# Altium schematic sheet DSP大板子.SchDoc (part 7 of 7)
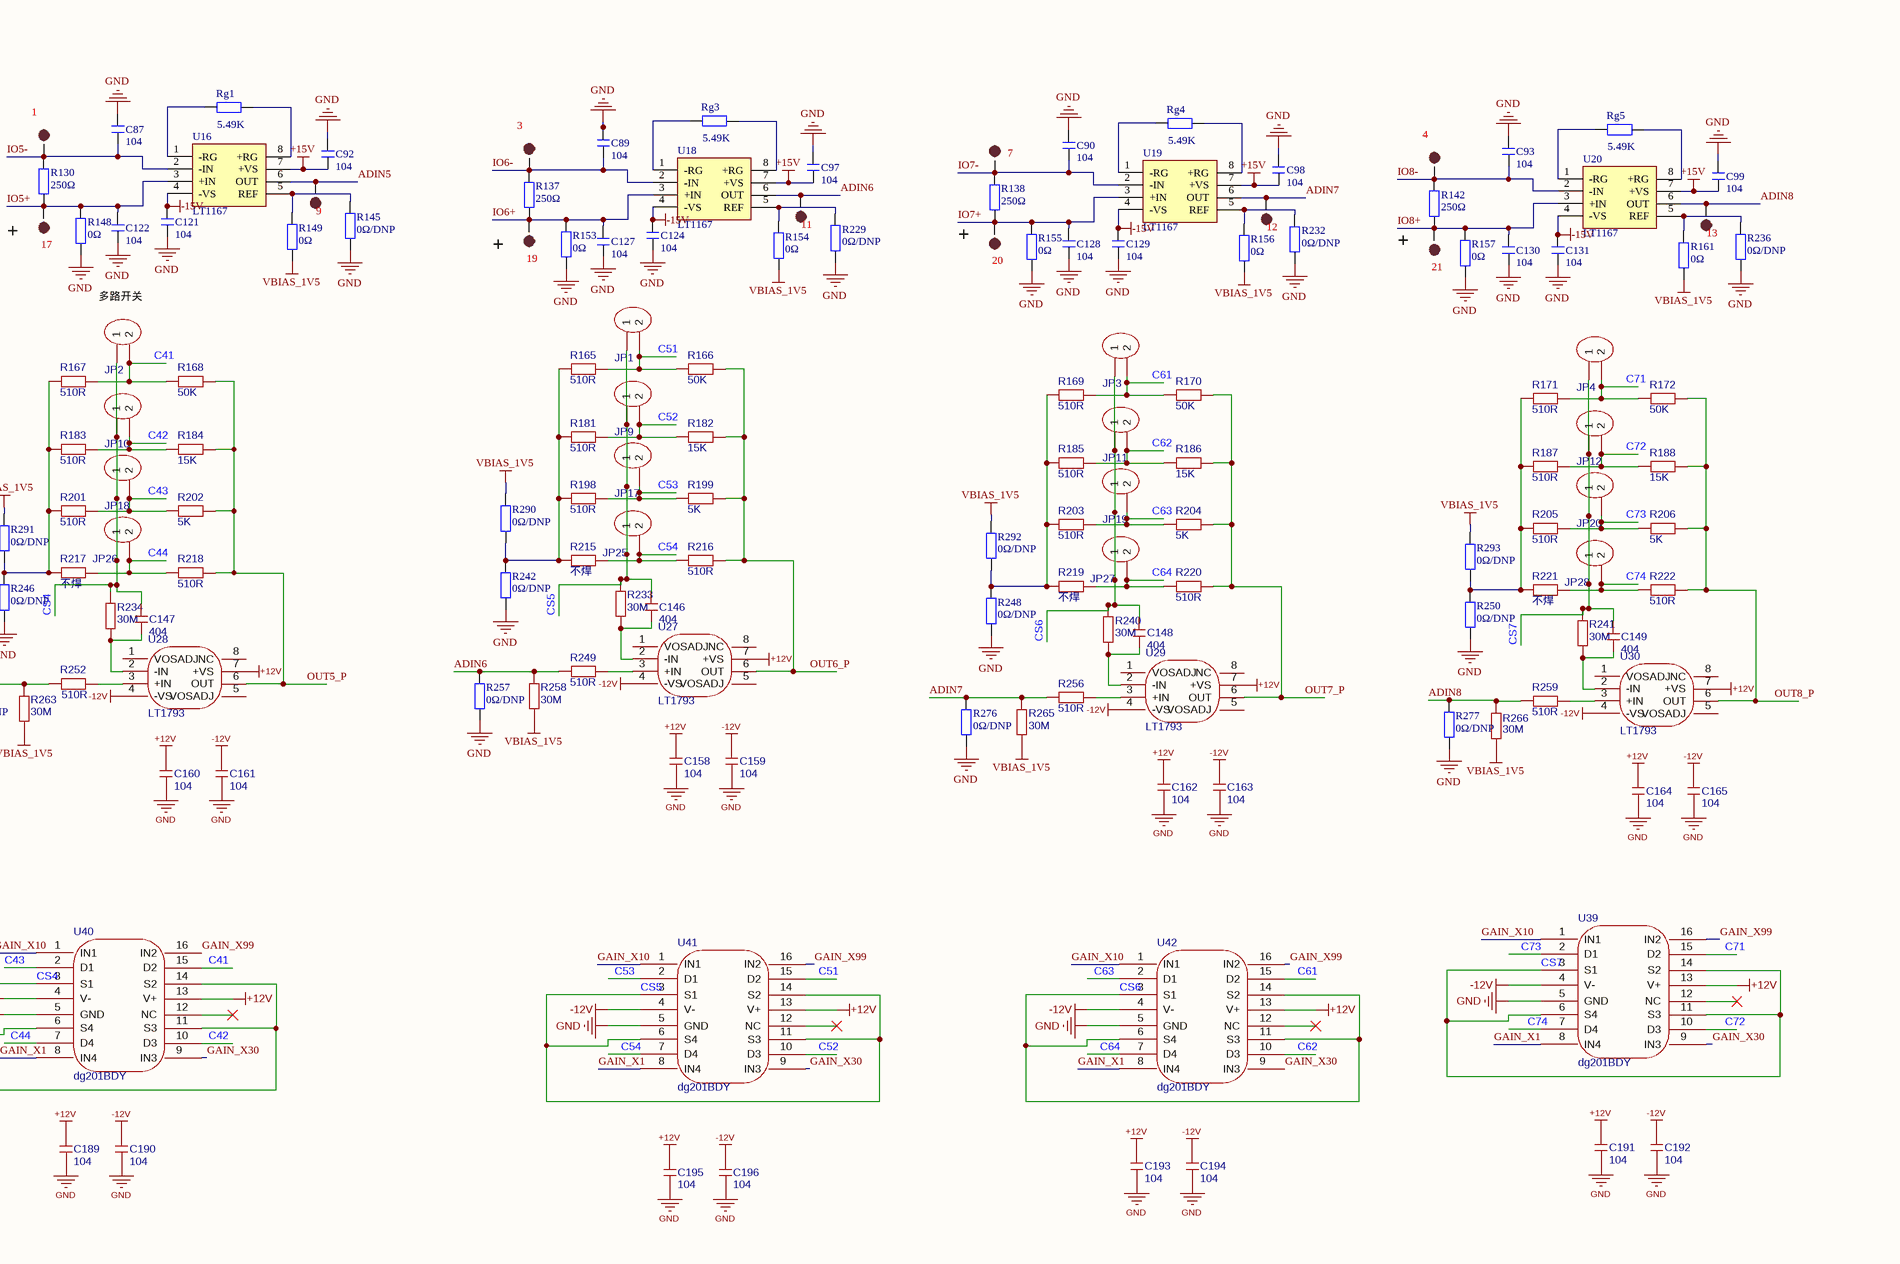
[diagram p8: DSP大板子.SchDoc, bottom right]

## Library data of the parts (continued)
R240 = R: 贴片电阻; 版权归属: 来自淘宝 ID：黄晶宝石; 封装库来自淘宝卖家 ID：黄晶宝石: 其他店铺购入均为盗版，不享受售后技术支持服务，请立即申请退款; Origin Footprint: R 0201_L; OriginFootprint 2: R 0402_L; OriginFootprint 3: R 0805_L; OriginFootprint 4: R 1206_L; OriginFootprint 5: R 1210_L; OriginFootprint 6: R 1812_L; OriginFootprint 7: R 2010_L; OriginFootprint 8: R 2512_L; OriginFootprint 9: R 0201_M; OriginFootprint 10: R 0402_M; OriginFootprint 11: R 0603_M; OriginFootprint 12: R 0805_M; OriginFootprint 13: R 1206_M; OriginFootprint 14: R 1210_M; OriginFootprint 15: R 1812_M; OriginFootprint 16: R 2010_M; OriginFootprint 17: R 2512_M; UniqueId: d3271885c7b6eafc; AddInBom: yes; OriginModelName: R 0603; Device: R; BOM名称: 贴片电阻; 联系售后: https://shop463601444.taobao.com; DesignItemID: R; LibraryName: 0.1 - 电阻-电容-电感; SymbolName: R; FootprintName: R 0603_L
R241 = R: 贴片电阻; 版权归属: 来自淘宝 ID：黄晶宝石; 封装库来自淘宝卖家 ID：黄晶宝石: 其他店铺购入均为盗版，不享受售后技术支持服务，请立即申请退款; Origin Footprint: R 0201_L; OriginFootprint 2: R 0402_L; OriginFootprint 3: R 0805_L; OriginFootprint 4: R 1206_L; OriginFootprint 5: R 1210_L; OriginFootprint 6: R 1812_L; OriginFootprint 7: R 2010_L; OriginFootprint 8: R 2512_L; OriginFootprint 9: R 0201_M; OriginFootprint 10: R 0402_M; OriginFootprint 11: R 0603_M; OriginFootprint 12: R 0805_M; OriginFootprint 13: R 1206_M; OriginFootprint 14: R 1210_M; OriginFootprint 15: R 1812_M; OriginFootprint 16: R 2010_M; OriginFootprint 17: R 2512_M; UniqueId: 81023e11c17a14a6; AddInBom: yes; OriginModelName: R 0603; Device: R; BOM名称: 贴片电阻; 联系售后: https://shop463601444.taobao.com; DesignItemID: R; LibraryName: 0.1 - 电阻-电容-电感; SymbolName: R; FootprintName: R 0603_L
R243 = R: 贴片电阻; 版权归属: 来自淘宝 ID：黄晶宝石; 封装库来自淘宝卖家 ID：黄晶宝石: 其他店铺购入均为盗版，不享受售后技术支持服务，请立即申请退款; Origin Footprint: R 0201_L; OriginFootprint 2: R 0402_L; OriginFootprint 3: R 0805_L; OriginFootprint 4: R 1206_L; OriginFootprint 5: R 1210_L; OriginFootprint 6: R 1812_L; OriginFootprint 7: R 2010_L; OriginFootprint 8: R 2512_L; OriginFootprint 9: R 0201_M; OriginFootprint 10: R 0402_M; OriginFootprint 11: R 0603_M; OriginFootprint 12: R 0805_M; OriginFootprint 13: R 1206_M; OriginFootprint 14: R 1210_M; OriginFootprint 15: R 1812_M; OriginFootprint 16: R 2010_M; OriginFootprint 17: R 2512_M; UniqueId: a074999702fa02e6; AddInBom: yes; OriginModelName: R 0603; Device: R; BOM名称: 贴片电阻; 联系售后: https://shop463601444.taobao.com; DesignItemID: R; LibraryName: 0.1 - 电阻-电容-电感; SymbolName: R; FootprintName: R 0603_L
R244 = R: 贴片电阻; 版权归属: 来自淘宝 ID：黄晶宝石; 封装库来自淘宝卖家 ID：黄晶宝石: 其他店铺购入均为盗版，不享受售后技术支持服务，请立即申请退款; Origin Footprint: R 0201_L; OriginFootprint 2: R 0402_L; OriginFootprint 3: R 0805_L; OriginFootprint 4: R 1206_L; OriginFootprint 5: R 1210_L; OriginFootprint 6: R 1812_L; OriginFootprint 7: R 2010_L; OriginFootprint 8: R 2512_L; OriginFootprint 9: R 0201_M; OriginFootprint 10: R 0402_M; OriginFootprint 11: R 0603_M; OriginFootprint 12: R 0805_M; OriginFootprint 13: R 1206_M; OriginFootprint 14: R 1210_M; OriginFootprint 15: R 1812_M; OriginFootprint 16: R 2010_M; OriginFootprint 17: R 2512_M; UniqueId: f8fa280bb9d4afdb; AddInBom: yes; OriginModelName: R 0603; Device: R; BOM名称: 贴片电阻; 联系售后: https://shop463601444.taobao.com; DesignItemID: R; LibraryName: 0.1 - 电阻-电容-电感; SymbolName: R; FootprintName: R 0603_L
R245 = R: 贴片电阻; 版权归属: 来自淘宝 ID：黄晶宝石; 封装库来自淘宝卖家 ID：黄晶宝石: 其他店铺购入均为盗版，不享受售后技术支持服务，请立即申请退款; Origin Footprint: R 0201_L; OriginFootprint 2: R 0402_L; OriginFootprint 3: R 0805_L; OriginFootprint 4: R 1206_L; OriginFootprint 5: R 1210_L; OriginFootprint 6: R 1812_L; OriginFootprint 7: R 2010_L; OriginFootprint 8: R 2512_L; OriginFootprint 9: R 0201_M; OriginFootprint 10: R 0402_M; OriginFootprint 11: R 0603_M; OriginFootprint 12: R 0805_M; OriginFootprint 13: R 1206_M; OriginFootprint 14: R 1210_M; OriginFootprint 15: R 1812_M; OriginFootprint 16: R 2010_M; OriginFootprint 17: R 2512_M; UniqueId: 780e728bcbe3c478; AddInBom: yes; OriginModelName: R 0603; Device: R; BOM名称: 贴片电阻; 联系售后: https://shop463601444.taobao.com; DesignItemID: R; LibraryName: 0.1 - 电阻-电容-电感; SymbolName: R; FootprintName: R 0603_L
R247 = R: 贴片电阻; 版权归属: 来自淘宝 ID：黄晶宝石; 封装库来自淘宝卖家 ID：黄晶宝石: 其他店铺购入均为盗版，不享受售后技术支持服务，请立即申请退款; Origin Footprint: R 0201_L; OriginFootprint 2: R 0402_L; OriginFootprint 3: R 0805_L; OriginFootprint 4: R 1206_L; OriginFootprint 5: R 1210_L; OriginFootprint 6: R 1812_L; OriginFootprint 7: R 2010_L; OriginFootprint 8: R 2512_L; OriginFootprint 9: R 0201_M; OriginFootprint 10: R 0402_M; OriginFootprint 11: R 0603_M; OriginFootprint 12: R 0805_M; OriginFootprint 13: R 1206_M; OriginFootprint 14: R 1210_M; OriginFootprint 15: R 1812_M; OriginFootprint 16: R 2010_M; OriginFootprint 17: R 2512_M; UniqueId: 61aee2c7162d13e5; AddInBom: yes; OriginModelName: R 0603; Device: R; BOM名称: 贴片电阻; 联系售后: https://shop463601444.taobao.com; DesignItemID: R; LibraryName: 0.1 - 电阻-电容-电感; SymbolName: R; FootprintName: R 0603_L
R249 = R: 贴片电阻; 版权归属: 来自淘宝 ID：黄晶宝石; 封装库来自淘宝卖家 ID：黄晶宝石: 其他店铺购入均为盗版，不享受售后技术支持服务，请立即申请退款; Origin Footprint: R 0201_L; OriginFootprint 2: R 0402_L; OriginFootprint 3: R 0805_L; OriginFootprint 4: R 1206_L; OriginFootprint 5: R 1210_L; OriginFootprint 6: R 1812_L; OriginFootprint 7: R 2010_L; OriginFootprint 8: R 2512_L; OriginFootprint 9: R 0201_M; OriginFootprint 10: R 0402_M; OriginFootprint 11: R 0603_M; OriginFootprint 12: R 0805_M; OriginFootprint 13: R 1206_M; OriginFootprint 14: R 1210_M; OriginFootprint 15: R 1812_M; OriginFootprint 16: R 2010_M; OriginFootprint 17: R 2512_M; UniqueId: a8dad4614b19f40e; AddInBom: yes; OriginModelName: R 0603; Device: R; BOM名称: 贴片电阻; 联系售后: https://shop463601444.taobao.com; DesignItemID: R; LibraryName: 0.1 - 电阻-电容-电感; SymbolName: R; FootprintName: R 0603_L
R252 = R: 贴片电阻; 版权归属: 来自淘宝 ID：黄晶宝石; 封装库来自淘宝卖家 ID：黄晶宝石: 其他店铺购入均为盗版，不享受售后技术支持服务，请立即申请退款; Origin Footprint: R 0201_L; OriginFootprint 2: R 0402_L; OriginFootprint 3: R 0805_L; OriginFootprint 4: R 1206_L; OriginFootprint 5: R 1210_L; OriginFootprint 6: R 1812_L; OriginFootprint 7: R 2010_L; OriginFootprint 8: R 2512_L; OriginFootprint 9: R 0201_M; OriginFootprint 10: R 0402_M; OriginFootprint 11: R 0603_M; OriginFootprint 12: R 0805_M; OriginFootprint 13: R 1206_M; OriginFootprint 14: R 1210_M; OriginFootprint 15: R 1812_M; OriginFootprint 16: R 2010_M; OriginFootprint 17: R 2512_M; UniqueId: 09a288aa9d6e3d92; AddInBom: yes; OriginModelName: R 0603; Device: R; BOM名称: 贴片电阻; 联系售后: https://shop463601444.taobao.com; DesignItemID: R; LibraryName: 0.1 - 电阻-电容-电感; SymbolName: R; FootprintName: R 0603_L
R256 = R: 贴片电阻; 版权归属: 来自淘宝 ID：黄晶宝石; 封装库来自淘宝卖家 ID：黄晶宝石: 其他店铺购入均为盗版，不享受售后技术支持服务，请立即申请退款; Origin Footprint: R 0201_L; OriginFootprint 2: R 0402_L; OriginFootprint 3: R 0805_L; OriginFootprint 4: R 1206_L; OriginFootprint 5: R 1210_L; OriginFootprint 6: R 1812_L; OriginFootprint 7: R 2010_L; OriginFootprint 8: R 2512_L; OriginFootprint 9: R 0201_M; OriginFootprint 10: R 0402_M; OriginFootprint 11: R 0603_M; OriginFootprint 12: R 0805_M; OriginFootprint 13: R 1206_M; OriginFootprint 14: R 1210_M; OriginFootprint 15: R 1812_M; OriginFootprint 16: R 2010_M; OriginFootprint 17: R 2512_M; UniqueId: 7c41b6516f1c60a6; AddInBom: yes; OriginModelName: R 0603; Device: R; BOM名称: 贴片电阻; 联系售后: https://shop463601444.taobao.com; DesignItemID: R; LibraryName: 0.1 - 电阻-电容-电感; SymbolName: R; FootprintName: R 0603_L
R258 = R: 贴片电阻; 版权归属: 来自淘宝 ID：黄晶宝石; 封装库来自淘宝卖家 ID：黄晶宝石: 其他店铺购入均为盗版，不享受售后技术支持服务，请立即申请退款; Origin Footprint: R 0201_L; OriginFootprint 2: R 0402_L; OriginFootprint 3: R 0805_L; OriginFootprint 4: R 1206_L; OriginFootprint 5: R 1210_L; OriginFootprint 6: R 1812_L; OriginFootprint 7: R 2010_L; OriginFootprint 8: R 2512_L; OriginFootprint 9: R 0201_M; OriginFootprint 10: R 0402_M; OriginFootprint 11: R 0603_M; OriginFootprint 12: R 0805_M; OriginFootprint 13: R 1206_M; OriginFootprint 14: R 1210_M; OriginFootprint 15: R 1812_M; OriginFootprint 16: R 2010_M; OriginFootprint 17: R 2512_M; UniqueId: 127bceab6ada68c7; AddInBom: yes; OriginModelName: R 0603; Device: R; BOM名称: 贴片电阻; 联系售后: https://shop463601444.taobao.com; DesignItemID: R; LibraryName: 0.1 - 电阻-电容-电感; SymbolName: R; FootprintName: R 0603_L
R259 = R: 贴片电阻; 版权归属: 来自淘宝 ID：黄晶宝石; 封装库来自淘宝卖家 ID：黄晶宝石: 其他店铺购入均为盗版，不享受售后技术支持服务，请立即申请退款; Origin Footprint: R 0201_L; OriginFootprint 2: R 0402_L; OriginFootprint 3: R 0805_L; OriginFootprint 4: R 1206_L; OriginFootprint 5: R 1210_L; OriginFootprint 6: R 1812_L; OriginFootprint 7: R 2010_L; OriginFootprint 8: R 2512_L; OriginFootprint 9: R 0201_M; OriginFootprint 10: R 0402_M; OriginFootprint 11: R 0603_M; OriginFootprint 12: R 0805_M; OriginFootprint 13: R 1206_M; OriginFootprint 14: R 1210_M; OriginFootprint 15: R 1812_M; OriginFootprint 16: R 2010_M; OriginFootprint 17: R 2512_M; UniqueId: 70403c1b3b132533; AddInBom: yes; OriginModelName: R 0603; Device: R; BOM名称: 贴片电阻; 联系售后: https://shop463601444.taobao.com; DesignItemID: R; LibraryName: 0.1 - 电阻-电容-电感; SymbolName: R; FootprintName: R 0603_L
R260 = R: 贴片电阻; 版权归属: 来自淘宝 ID：黄晶宝石; 封装库来自淘宝卖家 ID：黄晶宝石: 其他店铺购入均为盗版，不享受售后技术支持服务，请立即申请退款; Origin Footprint: R 0201_L; OriginFootprint 2: R 0402_L; OriginFootprint 3: R 0805_L; OriginFootprint 4: R 1206_L; OriginFootprint 5: R 1210_L; OriginFootprint 6: R 1812_L; OriginFootprint 7: R 2010_L; OriginFootprint 8: R 2512_L; OriginFootprint 9: R 0201_M; OriginFootprint 10: R 0402_M; OriginFootprint 11: R 0603_M; OriginFootprint 12: R 0805_M; OriginFootprint 13: R 1206_M; OriginFootprint 14: R 1210_M; OriginFootprint 15: R 1812_M; OriginFootprint 16: R 2010_M; OriginFootprint 17: R 2512_M; UniqueId: c7fcac2dc179deab; AddInBom: yes; OriginModelName: R 0603; Device: R; BOM名称: 贴片电阻; 联系售后: https://shop463601444.taobao.com; DesignItemID: R; LibraryName: 0.1 - 电阻-电容-电感; SymbolName: R; FootprintName: R 0603_L
R261 = R: 贴片电阻; 版权归属: 来自淘宝 ID：黄晶宝石; 封装库来自淘宝卖家 ID：黄晶宝石: 其他店铺购入均为盗版，不享受售后技术支持服务，请立即申请退款; Origin Footprint: R 0201_L; OriginFootprint 2: R 0402_L; OriginFootprint 3: R 0805_L; OriginFootprint 4: R 1206_L; OriginFootprint 5: R 1210_L; OriginFootprint 6: R 1812_L; OriginFootprint 7: R 2010_L; OriginFootprint 8: R 2512_L; OriginFootprint 9: R 0201_M; OriginFootprint 10: R 0402_M; OriginFootprint 11: R 0603_M; OriginFootprint 12: R 0805_M; OriginFootprint 13: R 1206_M; OriginFootprint 14: R 1210_M; OriginFootprint 15: R 1812_M; OriginFootprint 16: R 2010_M; OriginFootprint 17: R 2512_M; UniqueId: 3f1747bc7cd0165c; AddInBom: yes; OriginModelName: R 0603; Device: R; BOM名称: 贴片电阻; 联系售后: https://shop463601444.taobao.com; DesignItemID: R; LibraryName: 0.1 - 电阻-电容-电感; SymbolName: R; FootprintName: R 0603_L
R262 = R: 贴片电阻; 版权归属: 来自淘宝 ID：黄晶宝石; 封装库来自淘宝卖家 ID：黄晶宝石: 其他店铺购入均为盗版，不享受售后技术支持服务，请立即申请退款; Origin Footprint: R 0201_L; OriginFootprint 2: R 0402_L; OriginFootprint 3: R 0805_L; OriginFootprint 4: R 1206_L; OriginFootprint 5: R 1210_L; OriginFootprint 6: R 1812_L; OriginFootprint 7: R 2010_L; OriginFootprint 8: R 2512_L; OriginFootprint 9: R 0201_M; OriginFootprint 10: R 0402_M; OriginFootprint 11: R 0603_M; OriginFootprint 12: R 0805_M; OriginFootprint 13: R 1206_M; OriginFootprint 14: R 1210_M; OriginFootprint 15: R 1812_M; OriginFootprint 16: R 2010_M; OriginFootprint 17: R 2512_M; UniqueId: 086d1dd8ac2c5fca; AddInBom: yes; OriginModelName: R 0603; Device: R; BOM名称: 贴片电阻; 联系售后: https://shop463601444.taobao.com; DesignItemID: R; LibraryName: 0.1 - 电阻-电容-电感; SymbolName: R; FootprintName: R 0603_L
R263 = R: 贴片电阻; 版权归属: 来自淘宝 ID：黄晶宝石; 封装库来自淘宝卖家 ID：黄晶宝石: 其他店铺购入均为盗版，不享受售后技术支持服务，请立即申请退款; Origin Footprint: R 0201_L; OriginFootprint 2: R 0402_L; OriginFootprint 3: R 0805_L; OriginFootprint 4: R 1206_L; OriginFootprint 5: R 1210_L; OriginFootprint 6: R 1812_L; OriginFootprint 7: R 2010_L; OriginFootprint 8: R 2512_L; OriginFootprint 9: R 0201_M; OriginFootprint 10: R 0402_M; OriginFootprint 11: R 0603_M; OriginFootprint 12: R 0805_M; OriginFootprint 13: R 1206_M; OriginFootprint 14: R 1210_M; OriginFootprint 15: R 1812_M; OriginFootprint 16: R 2010_M; OriginFootprint 17: R 2512_M; UniqueId: 0b6333695f921556; AddInBom: yes; OriginModelName: R 0603; Device: R; BOM名称: 贴片电阻; 联系售后: https://shop463601444.taobao.com; DesignItemID: R; LibraryName: 0.1 - 电阻-电容-电感; SymbolName: R; FootprintName: R 0603_L
R264 = R: 贴片电阻; 版权归属: 来自淘宝 ID：黄晶宝石; 封装库来自淘宝卖家 ID：黄晶宝石: 其他店铺购入均为盗版，不享受售后技术支持服务，请立即申请退款; Origin Footprint: R 0201_L; OriginFootprint 2: R 0402_L; OriginFootprint 3: R 0805_L; OriginFootprint 4: R 1206_L; OriginFootprint 5: R 1210_L; OriginFootprint 6: R 1812_L; OriginFootprint 7: R 2010_L; OriginFootprint 8: R 2512_L; OriginFootprint 9: R 0201_M; OriginFootprint 10: R 0402_M; OriginFootprint 11: R 0603_M; OriginFootprint 12: R 0805_M; OriginFootprint 13: R 1206_M; OriginFootprint 14: R 1210_M; OriginFootprint 15: R 1812_M; OriginFootprint 16: R 2010_M; OriginFootprint 17: R 2512_M; UniqueId: 9e71ce6b7342da3b; AddInBom: yes; OriginModelName: R 0603; Device: R; BOM名称: 贴片电阻; 联系售后: https://shop463601444.taobao.com; DesignItemID: R; LibraryName: 0.1 - 电阻-电容-电感; SymbolName: R; FootprintName: R 0603_L
R265 = R: 贴片电阻; 版权归属: 来自淘宝 ID：黄晶宝石; 封装库来自淘宝卖家 ID：黄晶宝石: 其他店铺购入均为盗版，不享受售后技术支持服务，请立即申请退款; Origin Footprint: R 0201_L; OriginFootprint 2: R 0402_L; OriginFootprint 3: R 0805_L; OriginFootprint 4: R 1206_L; OriginFootprint 5: R 1210_L; OriginFootprint 6: R 1812_L; OriginFootprint 7: R 2010_L; OriginFootprint 8: R 2512_L; OriginFootprint 9: R 0201_M; OriginFootprint 10: R 0402_M; OriginFootprint 11: R 0603_M; OriginFootprint 12: R 0805_M; OriginFootprint 13: R 1206_M; OriginFootprint 14: R 1210_M; OriginFootprint 15: R 1812_M; OriginFootprint 16: R 2010_M; OriginFootprint 17: R 2512_M; UniqueId: 79cad709e969d650; AddInBom: yes; OriginModelName: R 0603; Device: R; BOM名称: 贴片电阻; 联系售后: https://shop463601444.taobao.com; DesignItemID: R; LibraryName: 0.1 - 电阻-电容-电感; SymbolName: R; FootprintName: R 0603_L
R266 = R: 贴片电阻; 版权归属: 来自淘宝 ID：黄晶宝石; 封装库来自淘宝卖家 ID：黄晶宝石: 其他店铺购入均为盗版，不享受售后技术支持服务，请立即申请退款; Origin Footprint: R 0201_L; OriginFootprint 2: R 0402_L; OriginFootprint 3: R 0805_L; OriginFootprint 4: R 1206_L; OriginFootprint 5: R 1210_L; OriginFootprint 6: R 1812_L; OriginFootprint 7: R 2010_L; OriginFootprint 8: R 2512_L; OriginFootprint 9: R 0201_M; OriginFootprint 10: R 0402_M; OriginFootprint 11: R 0603_M; OriginFootprint 12: R 0805_M; OriginFootprint 13: R 1206_M; OriginFootprint 14: R 1210_M; OriginFootprint 15: R 1812_M; OriginFootprint 16: R 2010_M; OriginFootprint 17: R 2512_M; UniqueId: d1ab67904d4ab3e5; AddInBom: yes; OriginModelName: R 0603; Device: R; BOM名称: 贴片电阻; 联系售后: https://shop463601444.taobao.com; DesignItemID: R; LibraryName: 0.1 - 电阻-电容-电感; SymbolName: R; FootprintName: R 0603_L
R267 = R: 贴片电阻; 版权归属: 来自淘宝 ID：黄晶宝石; 封装库来自淘宝卖家 ID：黄晶宝石: 其他店铺购入均为盗版，不享受售后技术支持服务，请立即申请退款; Origin Footprint: R 0201_L; OriginFootprint 2: R 0402_L; OriginFootprint 3: R 0805_L; OriginFootprint 4: R 1206_L; OriginFootprint 5: R 1210_L; OriginFootprint 6: R 1812_L; OriginFootprint 7: R 2010_L; OriginFootprint 8: R 2512_L; OriginFootprint 9: R 0201_M; OriginFootprint 10: R 0402_M; OriginFootprint 11: R 0603_M; OriginFootprint 12: R 0805_M; OriginFootprint 13: R 1206_M; OriginFootprint 14: R 1210_M; OriginFootprint 15: R 1812_M; OriginFootprint 16: R 2010_M; OriginFootprint 17: R 2512_M; UniqueId: f7952e9f9cd6773b; AddInBom: yes; OriginModelName: R 0603; Device: R; BOM名称: 贴片电阻; 联系售后: https://shop463601444.taobao.com; DesignItemID: R; LibraryName: 0.1 - 电阻-电容-电感; SymbolName: R; FootprintName: R 0603_L
R268 = R: 贴片电阻; 版权归属: 来自淘宝 ID：黄晶宝石; 封装库来自淘宝卖家 ID：黄晶宝石: 其他店铺购入均为盗版，不享受售后技术支持服务，请立即申请退款; Origin Footprint: R 0201_L; OriginFootprint 2: R 0402_L; OriginFootprint 3: R 0805_L; OriginFootprint 4: R 1206_L; OriginFootprint 5: R 1210_L; OriginFootprint 6: R 1812_L; OriginFootprint 7: R 2010_L; OriginFootprint 8: R 2512_L; OriginFootprint 9: R 0201_M; OriginFootprint 10: R 0402_M; OriginFootprint 11: R 0603_M; OriginFootprint 12: R 0805_M; OriginFootprint 13: R 1206_M; OriginFootprint 14: R 1210_M; OriginFootprint 15: R 1812_M; OriginFootprint 16: R 2010_M; OriginFootprint 17: R 2512_M; UniqueId: ee084f684bde39fa; AddInBom: yes; OriginModelName: R 0603; Device: R; BOM名称: 贴片电阻; 联系售后: https://shop463601444.taobao.com; DesignItemID: R; LibraryName: 0.1 - 电阻-电容-电感; SymbolName: R; FootprintName: R 0603_L
R269 = R: 贴片电阻; 版权归属: 来自淘宝 ID：黄晶宝石; 封装库来自淘宝卖家 ID：黄晶宝石: 其他店铺购入均为盗版，不享受售后技术支持服务，请立即申请退款; Origin Footprint: R 0201_L; OriginFootprint 2: R 0402_L; OriginFootprint 3: R 0805_L; OriginFootprint 4: R 1206_L; OriginFootprint 5: R 1210_L; OriginFootprint 6: R 1812_L; OriginFootprint 7: R 2010_L; OriginFootprint 8: R 2512_L; OriginFootprint 9: R 0201_M; OriginFootprint 10: R 0402_M; OriginFootprint 11: R 0603_M; OriginFootprint 12: R 0805_M; OriginFootprint 13: R 1206_M; OriginFootprint 14: R 1210_M; OriginFootprint 15: R 1812_M; OriginFootprint 16: R 2010_M; OriginFootprint 17: R 2512_M; UniqueId: 2eb3813281b987ab; AddInBom: yes; OriginModelName: R 0603; Device: R; BOM名称: 贴片电阻; 联系售后: https://shop463601444.taobao.com; DesignItemID: R; LibraryName: 0.1 - 电阻-电容-电感; SymbolName: R; FootprintName: R 0603_L
R270 = R: 贴片电阻; 版权归属: 来自淘宝 ID：黄晶宝石; 封装库来自淘宝卖家 ID：黄晶宝石: 其他店铺购入均为盗版，不享受售后技术支持服务，请立即申请退款; Origin Footprint: R 0201_L; OriginFootprint 2: R 0402_L; OriginFootprint 3: R 0805_L; OriginFootprint 4: R 1206_L; OriginFootprint 5: R 1210_L; OriginFootprint 6: R 1812_L; OriginFootprint 7: R 2010_L; OriginFootprint 8: R 2512_L; OriginFootprint 9: R 0201_M; OriginFootprint 10: R 0402_M; OriginFootprint 11: R 0603_M; OriginFootprint 12: R 0805_M; OriginFootprint 13: R 1206_M; OriginFootprint 14: R 1210_M; OriginFootprint 15: R 1812_M; OriginFootprint 16: R 2010_M; OriginFootprint 17: R 2512_M; UniqueId: fa394caafc8878d8; AddInBom: yes; OriginModelName: R 0603; Device: R; BOM名称: 贴片电阻; 联系售后: https://shop463601444.taobao.com; DesignItemID: R; LibraryName: 0.1 - 电阻-电容-电感; SymbolName: R; FootprintName: R 0603_L
R274 = rc0805fr-07100kl: 电阻类型:厚膜电阻;阻值:100kΩ;精度:±1%;功率:125mW;工作电压:150V;温度系数:±100ppm/℃;; Manufacturer: YAGEO(国巨); AddInBom: yes; ModelId: 37a81e68749a4138bd2dfa6897b24b85; ModelName: R0805_L2.0-W1.3-H0.6; ModelTransform: 78.74,51.181,0,0,0,0,0,-0.0005,0; Value: 100kΩ; Tolerance: ±1%; Power(Watts): 125mW; Voltage-Supply(Max): 150V; Symbol: RC0805FR-07100KL; LCSC Part Name: 厚膜电阻 100kΩ ±1% 125mW; SupplierPart: C96346; ManufacturerPart: RC0805FR-07100KL; Supplier Footprint: 0805; JLCPCB Part Class: Extended Part; Datasheet: https://item.szlcsc.com/datasheet/RC0805FR-07100KL/97550.html; Supplier: LCSC; ConvertToPcb: yes; FootprintName: R0805_NEW; Type: 厚膜电阻; Temperature Coefficient: ±100ppm/℃; Operating Temperature: -55℃~+155℃
RJ1 = si-46001-f: 连接器类型:RJ45插座;安装方式:弯插;端口数量:2;LED:带LED;屏蔽:有屏蔽;触头镀层:金;工作温度:0℃~+70℃;; Manufacturer: belfuse; AddInBom: yes; ModelId: 7e7265f4ce6d4878958776467abf3fc9; ModelTransform: 639.999,670.39236,0,0,0,0,0,-25.079,-157.48; Connector Type: RJ45插座; Number of Ports: 2; LED: 带LED; Shielding: 有屏蔽; PoE: 不带PoE; Symbol: SI-46001-F; LCSC Part Name: 弯插 带LED; SupplierPart: C19267755; ManufacturerPart: SI-46001-F; Supplier Footprint: RJ45-TH; JLCPCB Part Class: Extended Part; Datasheet: https://item.szlcsc.com/datasheet/SI-46001-F/20524665.html; Supplier: LCSC; ConvertToPcb: yes; FootprintName: RJ45-TH_BELFUSE_SI-46001-F; ModelName: RJ45-TH_BELFUSE_SI-46001-F; Mounting Type: 弯插; Contact Plating: 金; Operating Temperature: 0℃~+70℃
SW1 SW2 = TSW SMD-6x6: SW2; BOM名称: 贴片6x6轻触开关; 版权归属: 封装库来自淘宝 ID：黄晶宝石; 唯一出售店铺网址: https://shop463601444.taobao.com
SW3 = 2MS1T2B2VS2QES: BOM_Manufacturer: Dailywell; Contributor: LCSC; BOM_Supplier: LCSC; BOM_Supplier Part: C545202; BOM_Manufacturer Part: 2MS1T2B2VS2QES; BOM_JLCPCB Part Class: Extended Part; spicePre: S; spiceSymbolName: 2MS1T2B2VS2QES
U1 = CH340G: USB2UART
U2 = pc817x2csp9f: 输入类型:DC;正向压降(Vf):1.2V;输出电流:50mA;隔离电压(Vrms):5kV;直流反向耐压(Vr):6V;负载电压:80V;输出通道数:-;集射极饱和电压(VCE(sat)):200mV@20mA,1mA;; Manufacturer: SHARP(夏普); AddInBom: yes; ModelId: 991879f0d3e24dbd9895164815fb95aa; ModelName: SMD-4_L4.6-W6.5-H3.7-LS10.2-P2.54; ModelTransform: 401.94494,181.102,0,0,0,0,0,0.003,0; Input type: DC; Output Type: 光电三极管; Voltage - Forward(Vf): 1.2V; Output Current: 50mA; Isolation Voltage(Vrms): 5kV; Reverse Voltage: 6V; Load Voltage: 80V; Rise time: 4us; Fall time: 3us; Current Transfer Ratio (CTR) Minimum: 50%; Current Transfer Ratio (CTR) Maximum/Saturation Value: 600%; Total Power Dissipation(Pd): 200mW; Symbol: PC817X2CSP9F; LCSC Part Name: DC输入 隔离电压(rms):5000V; SupplierPart: C66405; ManufacturerPart: PC817X2CSP9F; Supplier Footprint: SMD-4P; JLCPCB Part Class: Extended Part; Datasheet: https://item.szlcsc.com/datasheet/PC817X2CSP9F/67489.html; Supplier: LCSC; ConvertToPcb: yes; FootprintName: SMD-4_L4.6-W6.5-P2.54-LS10.2-TL; Number of Outputs: -; Vce Saturation(VCE(sat)): 200mV@20mA,1mA; Operating Temperature: -30℃~+100℃; Forward Current(If): 50mA
U3 U10 = adau1979wbcpz-rl: 分辨率:24;工作电压:3.3V~3.6V;接口类型:I2C；SPI;; Manufacturer: ADI(亚德诺); AddInBom: yes; ModelId: 7c9bc19ca4c64354924a13059f0c15c7; ModelTransform: 237.007,237.007,0,0,0,0,0,0,0; Resolution: 24; Number of Channels: 4; Symbol: ADAU1979WBCPZ-RL; LCSC Part Name: 四通道模数转换器(ADC); SupplierPart: C207957; ManufacturerPart: ADAU1979WBCPZ-RL; Supplier Footprint: LFCSP-40(6x6); JLCPCB Part Class: Extended Part; Datasheet: https://item.szlcsc.com/datasheet/ADAU1979WBCPZ-RL/209011.html; Supplier: LCSC; ConvertToPcb: yes; FootprintName: QFN-40_L6.0-W6.0-P0.50-TL-EP4.1; ModelName: QFN-40_L6.0-W6.0-P0.50-TL-EP4.1; Voltage - Supply: 3.3V~3.6V; Interface Type: I2C；SPI; Operating Temperature: -40℃~+105℃
U4 = TJA1057GT3: CLASS: IC
U5 = m24c64-rmn6tp: 接口类型:I2C;存储容量:64Kbit;时钟频率(fc):1MHz;; Manufacturer: ST(意法半导体); AddInBom: yes; ModelId: 7abc64c95a1a4a04a4ef38f9097c870b; ModelTransform: 192.913,236.22,0,0,0,0,0,0,0; Interface: I2C; Memory Size: 64Kbit; Clock Frequency: 1MHz; Write Cycle Time(Tw): 5ms; Data Retention - TDR (Year): 200年; Write Cycle Endurance: 400万次; Voltage - Supply: 1.8V~5.5V; Symbol: M24C64-RMN6TP; LCSC Part Name: 64 Kbit串行I2C总线EEPROM; SupplierPart: C79988; ManufacturerPart: M24C64-RMN6TP; Supplier Footprint: SOIC-8; JLCPCB Part Class: Extended Part; Datasheet: https://item.szlcsc.com/datasheet/M24C64-RMN6TP/81133.html; Supplier: LCSC; ConvertToPcb: yes; FootprintName: SOIC-8_L5.0-W4.0-P1.27-LS6.0-BL; ModelName: SOIC-8_L5.0-W4.0-P1.27-LS6.0-BL; Features: 内置上电复位(POR)；硬件写保护功能；内置错误纠正码(ECC)功能; Operating Temperature: -40℃~+85℃
U6 = TJA1057GT3_8P: CLASS: IC
U7 U11 = gpha201-0202a001a1ba: 插针结构:2x2P;间距:2.54mm;行距:2.54mm;圆针/方针:方针;安装方式:直插;排数:双排;总PIN位数:4P;额定电流:3A;塑高:2.54mm;触头材质:黄铜;触头镀层:金;工作温度:-40℃~+105℃;颜色:黑色;; Manufacturer: GREENCONN(格康); AddInBom: yes; ModelId: 396726ecc332483f84428c142640bc15; ModelName: HDR-TH_4P-P2.54-M-LI-2X2P; ModelTransform: 200.03897,196.85,0,0,0,0,0,0,-118.11; Pin Structure: 2x2P; Pitch: 2.54mm; Circluar Pins/Square Pins: 方针; Current Rating: 3A; Symbol: GPHA201-0202A001A1BA; LCSC Part Name: 2x2P 间距:2.54mm 方针 直插; SupplierPart: C7434503; ManufacturerPart: GPHA201-0202A001A1BA; Supplier Footprint: 插件,P=2.54mm; JLCPCB Part Class: Extended Part; Datasheet: https://item.szlcsc.com/datasheet/GPHA201-0202A001A1BA/8446427.html; Supplier: LCSC; ConvertToPcb: yes; FootprintName: HDR-TH_4P-P2.54-V-M-R2-C2-S2.54; Row Spacing: 2.54mm; Mounting Type: 直插; Number of Rows: 双排; Number of Pins: 4P; Insulation Height: 2.54mm; Contact Material: 黄铜; Contact Plating: 金; Operating Temperature: -40℃~+105℃; Color: 黑色
U8 = hx pz2.54-1x2p zz: 插针结构:1x2P;间距:2.54mm;行距:-;圆针/方针:方针;安装方式:直插;排数:单排;总PIN位数:2P;额定电流:3A;额定电压:1kV;配合针长度:6mm;塑高:2.5mm;端接针长度:3mm;触头材质:黄铜;触头镀层:金;工作温度:-40℃~+105℃;颜色:黑色;; Manufacturer: hanxia(韩下); AddInBom: yes; ModelId: c7a9f3c3e6e34627af2bf939e464cb35; ModelName: HDR-TH_2P-P2.54-M-LI-1X2P; ModelTransform: 200,100,0,0,0,0,0,0,-118.11; Pin Structure: 1x2P; Pitch: 2.54mm; Circluar Pins/Square Pins: 方针; Current Rating: 3A; Voltage Rating (Max): 1kV; Symbol: HX PZ2.54-1X2P ZZ; LCSC Part Name: 1x2P 间距:2.54mm 方针 直插; SupplierPart: C32713268; ManufacturerPart: HX PZ2.54-1x2P ZZ; Supplier Footprint: 插件,P=2.54mm; JLCPCB Part Class: Extended Part; Datasheet: https://item.szlcsc.com/datasheet/HX%2520PZ2.54-1x2P%2520ZZ/34444548.html; Supplier: LCSC; ConvertToPcb: yes; FootprintName: HDR-TH_2P-P2.54-V-M-3; Row Spacing: -; Mounting Type: 直插; Number of Rows: 单排; Number of Pins: 2P; Length of Mating Pin: 6mm; Insulation Height: 2.5mm; Length of End Connection Pin: 3mm; Contact Material: 黄铜; Contact Plating: 金; Operating Temperature: -40℃~+105℃; Color: 黑色; Supplementary Features: -
U9 = mcp2515t-i/so: MCP2515是一款独立的CAN控制器，支持CAN V2.0B协议，数据传输速率为1 Mbps。它通过SPI接口与MCU通信。; Manufacturer: MICROCHIP(美国微芯); AddInBom: yes; ModelId: 591e416e62784c3bb8a96e1097595c87; ModelName: SOIC-18_L11.6-W7.5-H2.7-LS10.3-P1.27; ModelTransform: 456.692,409.68154,0,0,0,0,0,0,0; Data Rate: 1Mbps; Current - Supply: 5mA; Voltage - Supply: 2.7V~5.5V; Quiescent Supply Current: 1uA; Protocol: SPI; Symbol: MCP2515T-I/SO; LCSC Part Name: 独立CAN控制器带SPI接口; SupplierPart: C153782; ManufacturerPart: MCP2515T-I/SO; Supplier Footprint: SOIC-18-300mil; JLCPCB Part Class: Extended Part; Datasheet: https://item.szlcsc.com/datasheet/MCP2515T-I%252FSO/165124.html; Supplier: LCSC; ConvertToPcb: yes; FootprintName: SOIC-18_L11.6-W7.5-P1.27-LS10.3-BL; Type: CAN控制器; Operating Temperature: -40℃~+85℃; Features: 可编程位时序；单次发送模式；低功耗模式
U12 = ksz8081rnaca-tr: 类型:PHY收发器;端口数量:1;MAC接口:RMII;; Manufacturer: MICROCHIP(美国微芯); AddInBom: yes; ModelId: 1e6a51e223ba431598528b34e5bdfcc9; ModelName: QFN-24_L4.0-W4.0-H0.9-P0.50; ModelTransform: 157.48,157.48,0,90,0,0,0,0,0; Number of ports: 1; MAC Interface: RMII; Ethernet Speed Standards: 10BASE-T；100BASE-TX; Data Rate: 10Mbit/s；100Mbit/s; Voltage - Supply: 3.3V; Symbol: KSZ8081RNACA-TR; LCSC Part Name: KSZ8081RNA/RND 10BASE-T/100BASE-TX PHY 收发器; SupplierPart: C100017; ManufacturerPart: KSZ8081RNACA-TR; Supplier Footprint: QFN-24-EP(4x4); JLCPCB Part Class: Extended Part; Datasheet: https://item.szlcsc.com/datasheet/KSZ8081RNACA-TR/101231.html; Supplier: LCSC; ConvertToPcb: yes; FootprintName: QFN-24_L4.0-W4.0-P0.50-BL-EP2.6; Type: PHY收发器; Operating Temperature: 0℃~+70℃; Features: 错误检测与恢复；低功耗模式；可编程LED指示；电缆诊断
U13 = gpha101-0402a001a1ba: 插针结构:1x4P;间距:2.54mm;行距:2.54mm;圆针/方针:方针;安装方式:直插;排数:单排;总PIN位数:4P;额定电流:3A;塑高:2.54mm;触头材质:黄铜;触头镀层:金;工作温度:-40℃~+105℃;颜色:黑色;; Manufacturer: GREENCONN(格康); AddInBom: yes; ModelId: 112f4d05e8d64e99ab9a333894bea4f9; ModelName: HDR-TH_4P-P2.54-M-LI-1X4P; ModelTransform: 399.999,104.7242,0,0,0,0,0,0,-118.11; Pin Structure: 1x4P; Pitch: 2.54mm; Circluar Pins/Square Pins: 方针; Current Rating: 3A; Symbol: GPHA101-0402A001A1BA; LCSC Part Name: 1x4P 间距:2.54mm 方针 直插; SupplierPart: C7434478; ManufacturerPart: GPHA101-0402A001A1BA; Supplier Footprint: 插件,P=2.54mm; JLCPCB Part Class: Extended Part; Datasheet: https://item.szlcsc.com/datasheet/GPHA101-0402A001A1BA/8446402.html; Supplier: LCSC; ConvertToPcb: yes; FootprintName: HDR-TH_4P-P2.54-V-M; Row Spacing: 2.54mm; Mounting Type: 直插; Number of Rows: 单排; Number of Pins: 4P; Insulation Height: 2.54mm; Contact Material: 黄铜; Contact Plating: 金; Operating Temperature: -40℃~+105℃; Color: 黑色
U14 = lp5907mfx-3.3/nopb: 输出极性:正极;工作电压:5.5V;输出电压:3.3V;输出电流:250mA;电源纹波抑制比(PSRR):82dB@(1kHz);输出类型:固定;; Manufacturer: TI(德州仪器); AddInBom: yes; ModelId: 0a2a1b8f50944f73965918ad6e5fe167; ModelName: SOT-23-5_L2.9-W1.6-H1.1-LS2.8-P0.95; ModelTransform: 114.173,109.636,0,180,0,0,0,0,0; Output Configuration: 正极; Voltage - Supply: 5.5V; Output Voltage: 3.3V; Output Current: 250mA; Voltage Dropout: 250mV@(250mA); standby current: 12uA; Noise: 10uVrms; Output Type: 固定; Number of Outputs: 1; Symbol: LP5907MFX-3.3/NOPB; LCSC Part Name: 3.3V 250mA 5.5V; SupplierPart: C80670; ManufacturerPart: LP5907MFX-3.3/NOPB; Supplier Footprint: SOT-23-5; JLCPCB Part Class: Extended Part; Datasheet: https://www.ti.com/cn/lit/ds/symlink/lp5907.pdf; Supplier: LCSC; ConvertToPcb: yes; FootprintName: SOT-23-5_L3.0-W1.7-P0.95-LS2.8-BR; Power Supply Rejection Ratio (PSRR): 82dB@(1kHz); Features: 热关断；使能控制；输出放电；短路保护；输入欠压保护; Operating Temperature: -40℃~+125℃@(Tj)
U15 = AMS1117-3.3_C6186: Manufacturer: AMS; Add into BOM: yes; Output Type: 固定; Output Voltage: 3.3V; MAX Output Current: 1A; Power Supply Rejection Ratio (PSRR): 72dB@(120Hz); Dropout Voltage: 1.3V@(800mA); Output Polarity: 正极; Number of Outputs: 1; Symbol: AMS1117-3.3; Device: AMS1117-3.3_C6186; LCSC Part Name: 输出3.3V 1A; Supplier Part: C6186; Manufacturer Part: AMS1117-3.3; Supplier Footprint: SOT-223-3; JLCPCB Part Class: Basic Part; Datasheet: https://atta.szlcsc.com/upload/public/pdf/source/20180727/C6186_7A095716F0823C02F1997A905E26C086.pdf; Supplier: LCSC; Convert to PCB: yes; Maximum Input Voltage: -; standby current: -; Noise: -; Feature: -; Operating Temperature: -
U16-U23 = AD620BR: CI-AD620BR
U24 = tps54560bddar: 功能类型:降压型;工作电压:4.5V~60V;输出电压:800mV~58.8V;输出电流:5A;输出类型:可调;; Manufacturer: TI(德州仪器); AddInBom: yes; ModelId: 3be500d54979453db96888fa439d0a60; ModelTransform: 192.913,236.22,0,0,0,0,0,0,0; Function: 降压型; Output Current: 5A; Frequency - Switching: 500kHz; Synchronous Rectifier: 否; Number of Outputs: 1; Topology: 降压式; Quiescent Current: 146uA; Switch tube (built-in/external): 内置; Output Type: 可调; Symbol: TPS54560BDDAR; LCSC Part Name: 降压型 5A 4.5V~60V; SupplierPart: C1850354; ManufacturerPart: TPS54560BDDAR; Supplier Footprint: SO-8; JLCPCB Part Class: Extended Part; Datasheet: https://www.ti.com/cn/lit/gpn/tps54560b; Supplier: LCSC; ConvertToPcb: yes; FootprintName: POWERPAD-SO-8_L4.9-W3.9-P1.27-LS6.0-BL-EP; ModelName: POWERPAD-SO-8_L4.9-W3.9-P1.27-LS6.0-BL-EP; Voltage - Supply: 4.5V~60V; Output Voltage: 800mV~58.8V; Operating Temperature: -40℃~+150℃@(TJ); Features: 轻载高效模式；逐波限流；频率同步；过流保护
U25 = ura2412s-6wr3_c2757452: 特性：超宽4:1输入电压范围。 高效率达85%。 空载功耗低至0.24W。 I/O隔离测试电压1.5kV DC。 输入欠压保护，输出短路、过流保护。 工作环境温度范围：-40℃至+85℃。应用：医疗保健。 工业控制; Manufacturer: MORNSUN(金升阳); AddInBom: yes; ModelId: 59ee18447e164eb5803ce5c0826121e9; ModelTransform: 866.14,374.015,0,0,0,0,0,-81.299,-161.417; Number of Outputs: 2; Output Power: 6W; Voltage - Supply: 9V~36V; Conversion Efficiency: 83%; Output Voltage: ±12V; Output Current(Max): 250mA; Capacitive Load(Max): 120uF; Isolation Voltage(Vrms): 1.5kV; Value: 500kHz; Ripple Noise: 120mVp-p; Symbol: URA2412S-6WR3_C2757452; LCSC Part Name: 9V~36V ±12V 250mA 6W; SupplierPart: C2757452; ManufacturerPart: URA2412S-6WR3; Supplier Footprint: SIP,22x9.5mm; JLCPCB Part Class: Extended Part; Datasheet: https://item.szlcsc.com/datasheet/URA2412S-6WR3/2873721.html; Supplier: LCSC; ConvertToPcb: yes; FootprintName: PWRM-TH_URAXXXXS-6WR3; ModelName: PWRM-TH_URAXXXXS-6WR3; Type: -; Features: 欠压保护；短路保护；过流保护；轻载高效模式; Operating Temperature: -40℃~+85℃; Quiescent Supply Current: -; Length: 22mm; Width: 9.5mm; Height: 12mm; Voltage Regulation: -
U26 = ura2415ymd-15wr3: 特性：超宽4:1输入电压范围。高效率达90%。空载功耗低至0.24W。I/O隔离测试电压1.5kV DC。输入欠压保护、输出短路、过流、过压保护。工作环境温度范围：-40℃至+105℃。应用：工业控制。电力; Manufacturer: MORNSUN(金升阳); Symbol: URA2415YMD-15WR3_C5182197; AddInBom: yes; LCSC Part Name: 15W 隔离式 DC-DC 转换器; SupplierPart: C5182197; ManufacturerPart: URA2415YMD-15WR3; Supplier Footprint: DIP,25.4x25.4mm; JLCPCB Part Class: Extended Part; Datasheet: https://item.szlcsc.com/datasheet/URA2415YMD-15WR3/5842586.html; Supplier: LCSC; ConvertToPcb: yes; FootprintName: PWRM-TH_URA2415YMD-15WR3
U27 = LT1793: LT1793CS8#PBF; UniqueId: b94fd32bcc95872d; AddInBom: yes; OriginModelName: User Library-so-8; Device: LT1793; DesignItemID: LT1793; LibraryName: 1.6 - ADI系列精密运放; SymbolName: LT1793; FootprintName: SOP-8
U28 = LT1793: LT1793CS8#PBF; UniqueId: 2c27b242a2875aaf; AddInBom: yes; OriginModelName: User Library-so-8; Device: LT1793; DesignItemID: LT1793; LibraryName: 1.6 - ADI系列精密运放; SymbolName: LT1793; FootprintName: SOP-8
U29 = LT1793: LT1793CS8#PBF; UniqueId: be87043ebfc5f98d; AddInBom: yes; OriginModelName: User Library-so-8; Device: LT1793; DesignItemID: LT1793; LibraryName: 1.6 - ADI系列精密运放; SymbolName: LT1793; FootprintName: SOP-8
U30 = LT1793: LT1793CS8#PBF; UniqueId: 03a1f9b1f2129ca8; AddInBom: yes; OriginModelName: User Library-so-8; Device: LT1793; DesignItemID: LT1793; LibraryName: 1.6 - ADI系列精密运放; SymbolName: LT1793; FootprintName: SOP-8
U31 = LT1793: LT1793CS8#PBF; UniqueId: 4ec783ed4741de1f; AddInBom: yes; OriginModelName: User Library-so-8; Device: LT1793; DesignItemID: LT1793; LibraryName: 1.6 - ADI系列精密运放; SymbolName: LT1793; FootprintName: SOP-8
U32 = LT1793: LT1793CS8#PBF; UniqueId: 484e3008dca2bfa8; AddInBom: yes; OriginModelName: User Library-so-8; Device: LT1793; DesignItemID: LT1793; LibraryName: 1.6 - ADI系列精密运放; SymbolName: LT1793; FootprintName: SOP-8
U33 = LT1793: LT1793CS8#PBF; UniqueId: 2dbbb3175ebf36d7; AddInBom: yes; OriginModelName: User Library-so-8; Device: LT1793; DesignItemID: LT1793; LibraryName: 1.6 - ADI系列精密运放; SymbolName: LT1793; FootprintName: SOP-8
U34 = LT1793: LT1793CS8#PBF; UniqueId: 124c013cfc851acc; AddInBom: yes; OriginModelName: User Library-so-8; Device: LT1793; DesignItemID: LT1793; LibraryName: 1.6 - ADI系列精密运放; SymbolName: LT1793; FootprintName: SOP-8
U35 = DG201BDY-T1E3: UniqueId: 6151f2f354ad58a1; AddInBom: yes; Device: DG201BDY-T1E3; DesignItemID: DG201BDY-T1E3; LibraryName: 4.1 - 未分类器件; SymbolName: DG201BDY-T1E3; FootprintName: dg201BDY
U36 = DG201BDY-T1E3: UniqueId: ea6c5e45b64ed132; AddInBom: yes; Device: DG201BDY-T1E3; DesignItemID: DG201BDY-T1E3; LibraryName: 4.1 - 未分类器件; SymbolName: DG201BDY-T1E3; FootprintName: dg201BDY
U37 = DG201BDY-T1E3: UniqueId: 6e245fde712204fc; AddInBom: yes; Device: DG201BDY-T1E3; DesignItemID: DG201BDY-T1E3; LibraryName: 4.1 - 未分类器件; SymbolName: DG201BDY-T1E3; FootprintName: dg201BDY
U38 = DG201BDY-T1E3: UniqueId: 4bb3335060f18692; AddInBom: yes; Device: DG201BDY-T1E3; DesignItemID: DG201BDY-T1E3; LibraryName: 4.1 - 未分类器件; SymbolName: DG201BDY-T1E3; FootprintName: dg201BDY
U39 = DG201BDY-T1E3: UniqueId: ca4d2b64b6ec8380; AddInBom: yes; Device: DG201BDY-T1E3; DesignItemID: DG201BDY-T1E3; LibraryName: 4.1 - 未分类器件; SymbolName: DG201BDY-T1E3; FootprintName: dg201BDY
U40 = DG201BDY-T1E3: UniqueId: 1bdc0ab44f99f92d; AddInBom: yes; Device: DG201BDY-T1E3; DesignItemID: DG201BDY-T1E3; LibraryName: 4.1 - 未分类器件; SymbolName: DG201BDY-T1E3; FootprintName: dg201BDY
U41 = DG201BDY-T1E3: UniqueId: c69de7c088414df5; AddInBom: yes; Device: DG201BDY-T1E3; DesignItemID: DG201BDY-T1E3; LibraryName: 4.1 - 未分类器件; SymbolName: DG201BDY-T1E3; FootprintName: dg201BDY
U42 = DG201BDY-T1E3: UniqueId: 28995c53ef78d865; AddInBom: yes; Device: DG201BDY-T1E3; DesignItemID: DG201BDY-T1E3; LibraryName: 4.1 - 未分类器件; SymbolName: DG201BDY-T1E3; FootprintName: dg201BDY
U43 = ref2030aiddcr: 输出类型:固定;工作电压:3.02V~5.5V;输出电压:3V;输出电流:20mA;精度:±0.05%;; Manufacturer: TI(德州仪器); AddInBom: yes; ModelId: 018c57e721114987ae90467fe9f1d259; ModelTransform: 114.96,110.236,0,0,0,0,0,0,0; Output Type: 固定; Output Voltage: 3V; Output Current: 20mA; Tolerance: ±0.05%; Temperature Coefficient: 8ppm/℃; Reference Type: 串联; Quiescent Current: 460uA; Noise - 1/10Hz to 10Hz: 12ppmp-p; Symbol: REF2030AIDDCR; LCSC Part Name: 3.02V~5.5V 串联 460uA 8ppm/℃; SupplierPart: C528704; ManufacturerPart: REF2030AIDDCR; Supplier Footprint: SOT-23-5; JLCPCB Part Class: Extended Part; Datasheet: https://www.ti.com/cn/lit/ds/symlink/ref2030.pdf; Supplier: LCSC; ConvertToPcb: yes; FootprintName: SOT-23-5_L2.9-W1.6-P0.95-LS2.8-BL; ModelName: SOT-23-5_L2.9-W1.6-P0.95-LS2.8-BL; Voltage - Supply: 3.02V~5.5V; Minimum Cathode Current for Regulation: -; Noise - 10Hz to 10kHz: -; Operating Temperature: -40℃~+125℃; Features: 使能/关断；内置输出缓冲；多路参考输出
U44 = opa192idbvr: 放大器数:单路;增益带宽积(GBP):10MHz;输入偏置电流(Ib):5pA;输入失调电压(Vos):5uV;压摆率(SR):20V/us;轨到轨:轨到轨输入,轨到轨输出;; Manufacturer: TI(德州仪器); AddInBom: yes; ModelId: 0a2a1b8f50944f73965918ad6e5fe167; ModelName: SOT-23-5_L2.9-W1.6-H1.1-LS2.8-P0.95; ModelTransform: 118.60433,114.173,0,90,0,0,0.0005,0.0005,0; Number of Channels: 单路; Gain Bandwidth Product: 10MHz; Ib - Input Bias Current: 5pA; Vos - Input Offset Voltage: 5uV; Common Mode Rejection Ratio(CMRR): 140dB; Slew Rate: 20V/us; Output Current: 65mA; Input Offset Voltage Drift(Vos TC): 200nV/℃; Quiescent Current(Iq): 1mA; Single Supply: 4.5V~36V; Dual Supply: -18V~-2.25V；2.25V~18V; Maximum Power Supply Range (Vdd-Vss): 36V; Noise density(eN): 5.5nV/√Hz@1kHz; Input Offset Current(Ios): 2pA; Symbol: OPA192IDBVR; LCSC Part Name: 36V低失调电压、低输入偏置电流、轨到轨输入/输出精密运算放大器，具有e-trim特性; SupplierPart: C139648; ManufacturerPart: OPA192IDBVR; Supplier Footprint: SOT-23-5; JLCPCB Part Class: Extended Part; Datasheet: https://www.ti.com/cn/lit/gpn/opa192; Supplier: LCSC; ConvertToPcb: yes; FootprintName: SOT-23-5_L3.0-W1.7-P0.95-LS2.8-BL; Rail to Rail: 轨到轨输入,轨到轨输出; Operating Temperature: -40℃~+125℃
USB1 = MicroXNJ: Manufacturer: SHOU HAN(首韩); Add into BOM: yes; Connector Type: Micro-B; Gender: 母; Number of Ports: 1; Number of Contacts: 5P; Current Rating - Power (Max): 1A; Symbol: MICROXNJ; Device: MicroXNJ; Supplier: LCSC; Supplier Part: C404969; Manufacturer Part: MicroXNJ; JLCPCB Part Class: Extended Part; LCSC Part Name: Micro-B 母 卧贴; Supplier Footprint: SMD; Datasheet: https://atta.szlcsc.com/upload/public/pdf/source/20220415/2494EDFF499AF6F852F7C820374B6AF3.pdf; Convert to PCB: yes; Standard: USB 2.0; Mounting Style: 卧贴; Operating Temperature Range: -20℃~+85℃
X1 = 12MHz: BOM_Manufacturer: Yangxing Tech; BOM_Manufacturer Part: X49SM12MSB2SC; nameAlias: Frequency; Contributor: LCSC; BOM_Supplier: LCSC; BOM_Supplier Part: C110563; BOM_JLCPCB Part Class: Extended Part; spicePre: X; spiceSymbolName: X49SM12MSB2SC
X2 = x503216msb2gi: 晶振类型:贴片晶振;频率:16MHz;常温频差:±10ppm;负载电容:20pF;频率稳定度:±20ppm;; Manufacturer: YXC(扬兴晶振); AddInBom: yes; ModelId: 36c8b961b9064b60a7c920ab5154e867; ModelName: OSC-SMD_L5.0-W3.2-H1.4; ModelTransform: 196.85,126.023,0,0,0,0,0,0,0; Value: 16MHz; Normal temperature Frequency Tolerance: ±10ppm; Load Capacitance: 20pF; Frequency Stability: ±20ppm; Equivalent Series Resistance(ESR): 80Ω; Symbol: X503216MSB2GI; LCSC Part Name: YSX530GA 16MHZ 2P 5032 20PF ±10PPM -40~85℃ (±20PPM); SupplierPart: C112572; ManufacturerPart: X503216MSB2GI; Supplier Footprint: SMD5032-2P; JLCPCB Part Class: Extended Part; Datasheet: https://item.szlcsc.com/datasheet/X503216MSB2GI/113805.html; Supplier: LCSC; ConvertToPcb: yes; FootprintName: OSC-SMD_L5.0-W3.2; Type: 贴片晶振; Operating Temperature: -40℃~+85℃
Y1 = CRYSTAL_4P: CLASS: IC
Z1 Z2 = DIODE BI-DIR TRIG